# Altium project Servo-Board-v1.0.PrjPcb (part 23 of 23)
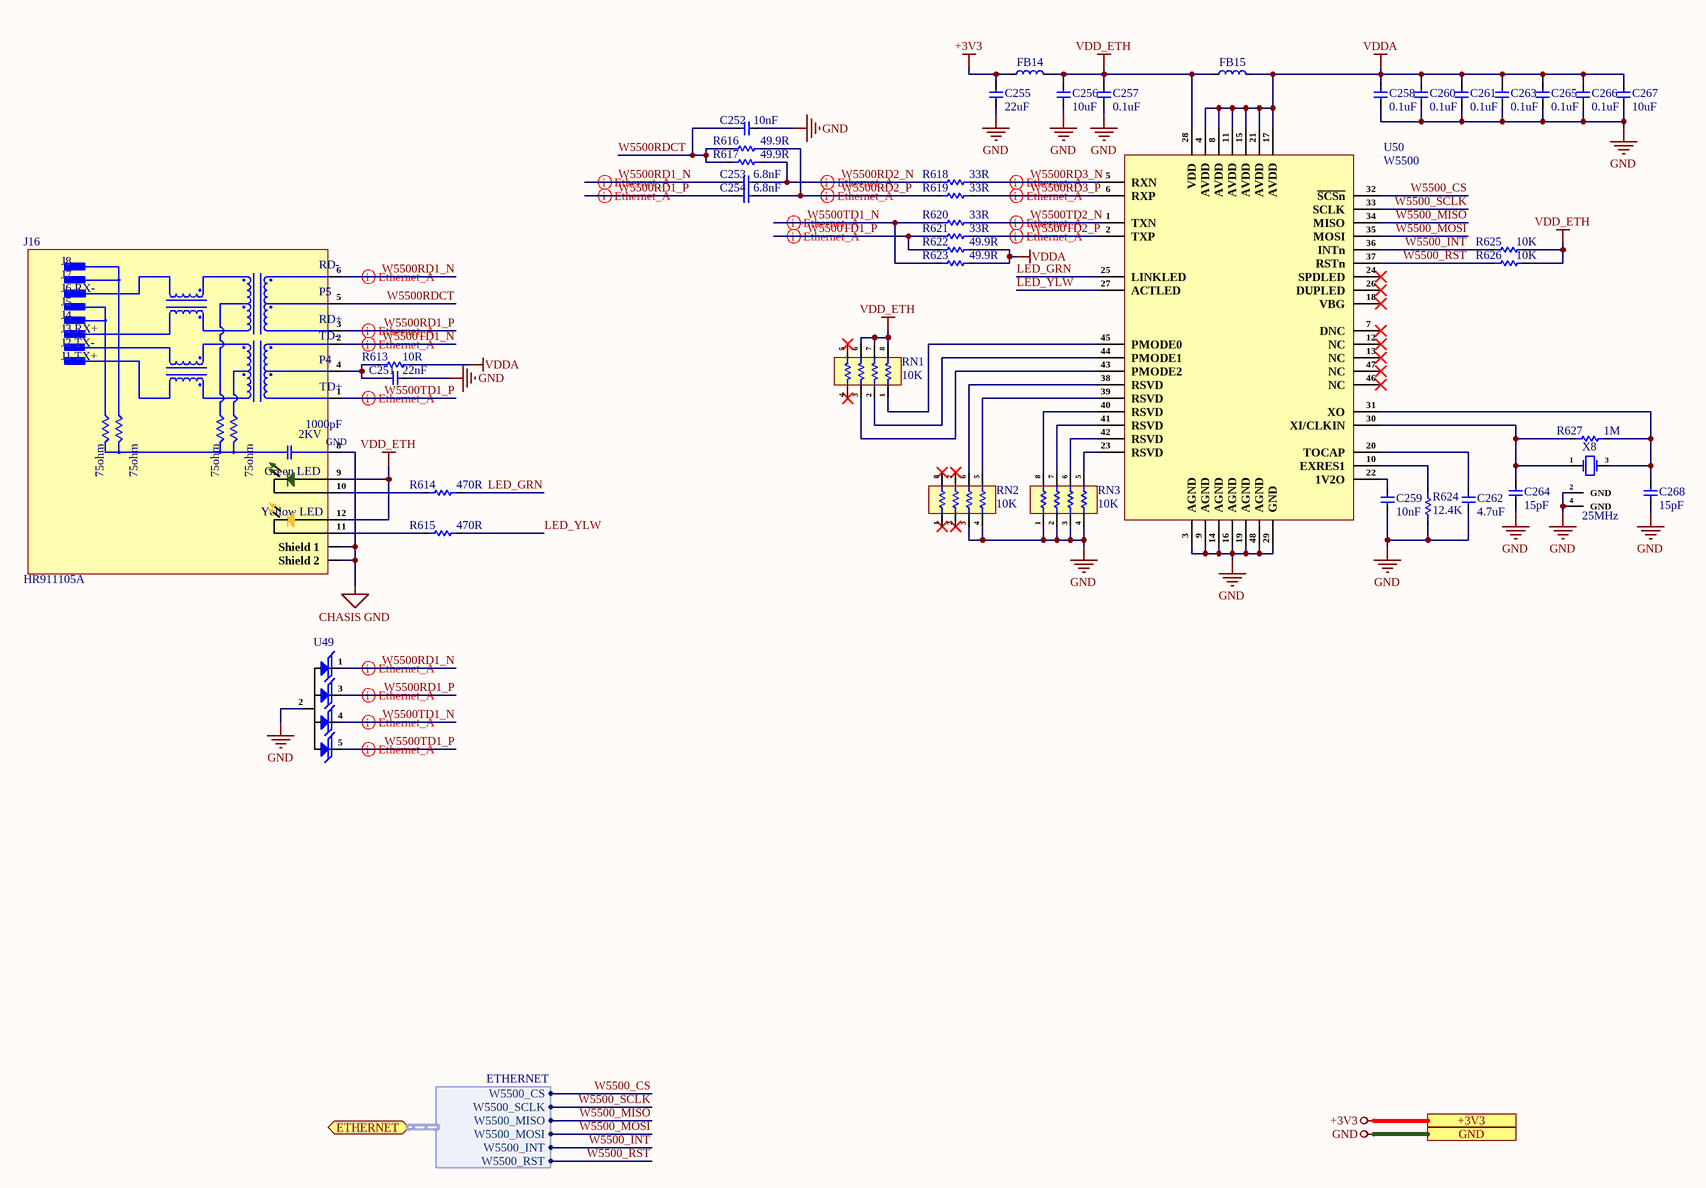
[diagram p27: Ethernet-Sheet.SchDoc]

## Nets that join several sheets
+3V3: Controller_Sheet (14 pins), CAN_Sheet (C54.2 C56.2 U6.5 U7.5), RS485_RS232_Sheet (16 pins), EtherCAT_Sheet (27 pins), Sec_Controller_Sheet3 (16 pins), Motor_Driver_Sheet3 (5 pins), Encoder_Sheet3 (5 pins), DIO_3 (7 pins), Sec_Controller_Sheet4 (16 pins), Motor_Driver_Sheet4 (5 pins), Encoder_Sheet4 (5 pins), DIO_4 (7 pins), Power_Sheet (C52.2 R23.1 TP3.1 U5.3), Sec_Controller_Sheet1 (16 pins), Motor_Driver_Sheet1 (5 pins), Encoder_Sheet1 (5 pins), DIO_1 (7 pins), Sec_Controller_Sheet2 (16 pins), Motor_Driver_Sheet2 (5 pins), Encoder_Sheet2 (5 pins), DIO_2 (7 pins), Ethernet-Sheet (C255.2 FB14.1)
+5V: Controller_Sheet (R12.2), CAN_Sheet (10 pins), Sec_Controller_Sheet3 (R127.2), Encoder_Sheet3 (9 pins), DIO_3 (8 pins), Sec_Controller_Sheet4 (R141.2), Encoder_Sheet4 (9 pins), DIO_4 (8 pins), Power_Sheet (14 pins), Sec_Controller_Sheet1 (R99.2), Encoder_Sheet1 (9 pins), DIO_1 (8 pins), Sec_Controller_Sheet2 (R113.2), Encoder_Sheet2 (9 pins), DIO_2 (8 pins)
+10V: DIO_3 (PT9.1 PT10.1 PT11.1 PT12.1), DIO_4 (PT13.1 PT14.1 PT15.1 PT16.1), Power_Sheet (C20.1 R19.2 U2.15), DIO_1 (PT1.1 PT2.1 PT3.1 PT4.1), DIO_2 (PT5.1 PT6.1 PT7.1 PT8.1)
+24V: DIO_3 (9 pins), DIO_4 (9 pins), Power_Sheet (13 pins), DIO_1 (9 pins), DIO_2 (9 pins)
+24V-MOT-1: Power_Sheet (7 pins), Motor_Driver_Sheet1 (18 pins)
+24V-MOT-2: Power_Sheet (7 pins), Motor_Driver_Sheet2 (18 pins)
+24V-MOT-3: Motor_Driver_Sheet3 (18 pins), Power_Sheet (7 pins)
+24V-MOT-4: Motor_Driver_Sheet4 (18 pins), Power_Sheet (7 pins)
-10V: DIO_3 (R510.2 R512.2 R534.2 R536.2), DIO_4 (R574.2 R576.2 R598.2 R600.2), Power_Sheet (C18.2 R18.2 U2.5), DIO_1 (R387.2 R389.2 R406.2 R408.2), DIO_2 (R450.2 R452.2 R470.2 R472.2)
CHASIS GND: EtherCAT_Sheet (6 pins), Motor_Driver_Sheet3 (J42.4), Encoder_Sheet3 (J49.1), DIO_3 (J54.45 J54.46 J55.45 J55.46), Motor_Driver_Sheet4 (J43.4), Encoder_Sheet4 (J51.1), DIO_4 (J56.45 J56.46 J57.45 J57.46), Power_Sheet (J11.1), Motor_Driver_Sheet1 (J40.4), Encoder_Sheet1 (J26.1), DIO_1 (J25.45 J25.46 J36.45 J36.46), Motor_Driver_Sheet2 (J41.4), Encoder_Sheet2 (J47.1), DIO_2 (J52.45 J52.46 J53.45 J53.46), Ethernet-Sheet (J16.8 J16.Shield 1 J16.Shield 2)
GND: Controller_Sheet (32 pins), CAN_Sheet (20 pins), RS485_RS232_Sheet (19 pins), EtherCAT_Sheet (46 pins), Sec_Controller_Sheet3 (30 pins), Motor_Driver_Sheet3 (41 pins), Encoder_Sheet3 (9 pins), DIO_3 (47 pins), Sec_Controller_Sheet4 (30 pins), Motor_Driver_Sheet4 (41 pins), Encoder_Sheet4 (9 pins), DIO_4 (47 pins), Power_Sheet (57 pins), Sec_Controller_Sheet1 (30 pins), Motor_Driver_Sheet1 (41 pins), Encoder_Sheet1 (9 pins), DIO_1 (47 pins), Sec_Controller_Sheet2 (30 pins), Motor_Driver_Sheet2 (41 pins), Encoder_Sheet2 (9 pins), DIO_2 (47 pins), Ethernet-Sheet (33 pins)
CAL-1: Sec_Controller_Sheet1 (U13.65), Motor_Driver_Sheet1 (U17.34)
CAL-2: Sec_Controller_Sheet2 (U14.65), Motor_Driver_Sheet2 (U18.34)
CAL-3: Sec_Controller_Sheet3 (U15.65), Motor_Driver_Sheet3 (U19.34)
CAL-4: Sec_Controller_Sheet4 (U16.65), Motor_Driver_Sheet4 (U20.34)
CAN1_RX: Controller_Sheet (U1.50), CAN_Sheet (R30.2)
CAN1_TX: Controller_Sheet (U1.51), CAN_Sheet (R31.2)
CAN2_RX: Controller_Sheet (U1.15), CAN_Sheet (R32.2)
CAN2_TX: Controller_Sheet (U1.16), CAN_Sheet (R33.2)
DRV_EN-1: Sec_Controller_Sheet1 (U13.97), Motor_Driver_Sheet1 (U17.33)
DRV_EN-2: Sec_Controller_Sheet2 (U14.97), Motor_Driver_Sheet2 (U18.33)
DRV_EN-3: Sec_Controller_Sheet3 (U15.97), Motor_Driver_Sheet3 (U19.33)
DRV_EN-4: Sec_Controller_Sheet4 (U16.97), Motor_Driver_Sheet4 (U20.33)
EN_CAN: Controller_Sheet (U1.57), CAN_Sheet (U6.6)
EN_CAN_2: Controller_Sheet (U1.39), CAN_Sheet (U7.6)
EXTI1-1: Sec_Controller_Sheet1 (U13.98), DIO_1 (R355.1)
EXTI1-2: Sec_Controller_Sheet2 (U14.98), DIO_2 (R418.1)
EXTI1-3: Sec_Controller_Sheet3 (U15.98), DIO_3 (R482.1)
EXTI1-4: Sec_Controller_Sheet4 (U16.98), DIO_4 (R546.1)
EXTI2-1: Sec_Controller_Sheet1 (U13.1), DIO_1 (R356.1)
EXTI2-2: Sec_Controller_Sheet2 (U14.1), DIO_2 (R419.1)
EXTI2-3: Sec_Controller_Sheet3 (U15.1), DIO_3 (R483.1)
EXTI2-4: Sec_Controller_Sheet4 (U16.1), DIO_4 (R547.1)
EXTI3-1: Sec_Controller_Sheet1 (U13.2), DIO_1 (R357.1)
EXTI3-2: Sec_Controller_Sheet2 (U14.2), DIO_2 (R420.1)
EXTI3-3: Sec_Controller_Sheet3 (U15.2), DIO_3 (R484.1)
EXTI3-4: Sec_Controller_Sheet4 (U16.2), DIO_4 (R548.1)
EXTI4-1: Sec_Controller_Sheet1 (U13.3), DIO_1 (R358.1)
EXTI4-2: Sec_Controller_Sheet2 (U14.3), DIO_2 (R421.1)
EXTI4-3: Sec_Controller_Sheet3 (U15.3), DIO_3 (R485.1)
EXTI4-4: Sec_Controller_Sheet4 (U16.3), DIO_4 (R549.1)
EXTI5-1: Sec_Controller_Sheet1 (U13.4), DIO_1 (R359.1)
EXTI5-2: Sec_Controller_Sheet2 (U14.4), DIO_2 (R422.1)
EXTI5-3: Sec_Controller_Sheet3 (U15.4), DIO_3 (R486.1)
EXTI5-4: Sec_Controller_Sheet4 (U16.4), DIO_4 (R550.1)
EXTI6-1: Sec_Controller_Sheet1 (U13.5), DIO_1 (R360.1)
EXTI6-2: Sec_Controller_Sheet2 (U14.5), DIO_2 (R423.1)
EXTI6-3: Sec_Controller_Sheet3 (U15.5), DIO_3 (R487.1)
EXTI6-4: Sec_Controller_Sheet4 (U16.5), DIO_4 (R551.1)
EXTI7-1: Sec_Controller_Sheet1 (U13.38), DIO_1 (R361.1)
EXTI7-2: Sec_Controller_Sheet2 (U14.38), DIO_2 (R424.1)
EXTI7-3: Sec_Controller_Sheet3 (U15.38), DIO_3 (R488.1)
EXTI7-4: Sec_Controller_Sheet4 (U16.38), DIO_4 (R552.1)
EXTI8-1: Sec_Controller_Sheet1 (U13.39), DIO_1 (R362.1)
EXTI8-2: Sec_Controller_Sheet2 (U14.39), DIO_2 (R425.1)
EXTI8-3: Sec_Controller_Sheet3 (U15.39), DIO_3 (R489.1)
EXTI8-4: Sec_Controller_Sheet4 (U16.39), DIO_4 (R553.1)
EXTO1-1: Sec_Controller_Sheet1 (U13.40), DIO_1 (R379.1 U29.16)
EXTO1-2: Sec_Controller_Sheet2 (U14.40), DIO_2 (R442.1 U36.16)
EXTO1-3: Sec_Controller_Sheet3 (U15.40), DIO_3 (R506.1 U41.16)
EXTO1-4: Sec_Controller_Sheet4 (U16.40), DIO_4 (R570.1 U46.16)
EXTO2-1: Sec_Controller_Sheet1 (U13.41), DIO_1 (R377.1 U29.14)
EXTO2-2: Sec_Controller_Sheet2 (U14.41), DIO_2 (R440.1 U36.14)
EXTO2-3: Sec_Controller_Sheet3 (U15.41), DIO_3 (R504.1 U41.14)
EXTO2-4: Sec_Controller_Sheet4 (U16.41), DIO_4 (R568.1 U46.14)
EXTO3-1: Sec_Controller_Sheet1 (U13.42), DIO_1 (R376.1 U29.12)
EXTO3-2: Sec_Controller_Sheet2 (U14.42), DIO_2 (R439.1 U36.12)
EXTO3-3: Sec_Controller_Sheet3 (U15.42), DIO_3 (R503.1 U41.12)
EXTO3-4: Sec_Controller_Sheet4 (U16.42), DIO_4 (R567.1 U46.12)
EXTO4-1: Sec_Controller_Sheet1 (U13.43), DIO_1 (R375.1 U29.10)
EXTO4-2: Sec_Controller_Sheet2 (U14.43), DIO_2 (R438.1 U36.10)
EXTO4-3: Sec_Controller_Sheet3 (U15.43), DIO_3 (R502.1 U41.10)
EXTO4-4: Sec_Controller_Sheet4 (U16.43), DIO_4 (R566.1 U46.10)
EXTO5-1: Sec_Controller_Sheet1 (U13.44), DIO_1 (R380.1 U30.16)
EXTO5-2: Sec_Controller_Sheet2 (U14.44), DIO_2 (R443.1 U37.16)
EXTO5-3: Sec_Controller_Sheet3 (U15.44), DIO_3 (R507.1 U42.16)
EXTO5-4: Sec_Controller_Sheet4 (U16.44), DIO_4 (R571.1 U47.16)
EXTO6-1: Sec_Controller_Sheet1 (U13.45), DIO_1 (R378.1 U30.14)
EXTO6-2: Sec_Controller_Sheet2 (U14.45), DIO_2 (R441.1 U37.14)
EXTO6-3: Sec_Controller_Sheet3 (U15.45), DIO_3 (R505.1 U42.14)
EXTO6-4: Sec_Controller_Sheet4 (U16.45), DIO_4 (R569.1 U47.14)
EXTOCZ-1: Sec_Controller_Sheet1 (U13.81), DIO_1 (U31.5)
EXTOCZ-2: Sec_Controller_Sheet2 (U14.81), DIO_2 (U38.5)
EXTOCZ-3: Sec_Controller_Sheet3 (U15.81), DIO_3 (U43.5)
EXTOCZ-4: Sec_Controller_Sheet4 (U16.81), DIO_4 (U48.5)
FAULT-1: Sec_Controller_Sheet1 (U13.66), Motor_Driver_Sheet1 (R145.2 R148.2 U17.28)
FAULT-2: Sec_Controller_Sheet2 (U14.66), Motor_Driver_Sheet2 (R178.2 R181.2 U18.28)
FAULT-3: Sec_Controller_Sheet3 (U15.66), Motor_Driver_Sheet3 (R211.2 R214.2 U19.28)
FAULT-4: Sec_Controller_Sheet4 (U16.66), Motor_Driver_Sheet4 (R244.2 R247.2 U20.28)
INH_MASK: Controller_Sheet (U1.58), CAN_Sheet (U6.11)
INH_MASK_2: Controller_Sheet (U1.36), CAN_Sheet (U7.11)
INHA-1: Sec_Controller_Sheet1 (U13.67), Motor_Driver_Sheet1 (D24.3 U17.37)
INHA-2: Sec_Controller_Sheet2 (U14.67), Motor_Driver_Sheet2 (D29.1 U18.37)
INHA-3: Sec_Controller_Sheet3 (U15.67), Motor_Driver_Sheet3 (D34.3 U19.37)
INHA-4: Sec_Controller_Sheet4 (U16.67), Motor_Driver_Sheet4 (D39.1 U20.37)
INHB-1: Sec_Controller_Sheet1 (U13.68), Motor_Driver_Sheet1 (D24.4 U17.39)
INHB-2: Sec_Controller_Sheet2 (U14.68), Motor_Driver_Sheet2 (D29.6 U18.39)
INHB-3: Sec_Controller_Sheet3 (U15.68), Motor_Driver_Sheet3 (D34.4 U19.39)
INHB-4: Sec_Controller_Sheet4 (U16.68), Motor_Driver_Sheet4 (D39.6 U20.39)
INHC-1: Sec_Controller_Sheet1 (U13.69), Motor_Driver_Sheet1 (D26.6 U17.41)
INHC-2: Sec_Controller_Sheet2 (U14.69), Motor_Driver_Sheet2 (D31.6 U18.41)
INHC-3: Sec_Controller_Sheet3 (U15.69), Motor_Driver_Sheet3 (D36.6 U19.41)
INHC-4: Sec_Controller_Sheet4 (U16.69), Motor_Driver_Sheet4 (D41.6 U20.41)
INLA-1: Sec_Controller_Sheet1 (U13.34), Motor_Driver_Sheet1 (D24.1 U17.38)
INLA-2: Sec_Controller_Sheet2 (U14.34), Motor_Driver_Sheet2 (D29.3 U18.38)
INLA-3: Sec_Controller_Sheet3 (U15.34), Motor_Driver_Sheet3 (D34.1 U19.38)
INLA-4: Sec_Controller_Sheet4 (U16.34), Motor_Driver_Sheet4 (D39.3 U20.38)
INLB-1: Sec_Controller_Sheet1 (U13.63), Motor_Driver_Sheet1 (D24.6 U17.40)
INLB-2: Sec_Controller_Sheet2 (U14.63), Motor_Driver_Sheet2 (D29.4 U18.40)
INLB-3: Sec_Controller_Sheet3 (U15.63), Motor_Driver_Sheet3 (D34.6 U19.40)
INLB-4: Sec_Controller_Sheet4 (U16.63), Motor_Driver_Sheet4 (D39.4 U20.40)
INLC-1: Sec_Controller_Sheet1 (U13.64), Motor_Driver_Sheet1 (D26.4 U17.42)
INLC-2: Sec_Controller_Sheet2 (U14.64), Motor_Driver_Sheet2 (D31.4 U18.42)
INLC-3: Sec_Controller_Sheet3 (U15.64), Motor_Driver_Sheet3 (D36.4 U19.42)
INLC-4: Sec_Controller_Sheet4 (U16.64), Motor_Driver_Sheet4 (D41.4 U20.42)
ISENA-1: Sec_Controller_Sheet1 (U13.15), Motor_Driver_Sheet1 (C126.2 D25.4 R163.2)
ISENA-2: Sec_Controller_Sheet2 (U14.15), Motor_Driver_Sheet2 (C151.2 D30.4 R196.2)
ISENA-3: Sec_Controller_Sheet3 (U15.15), Motor_Driver_Sheet3 (C176.2 D35.4 R229.2)
ISENA-4: Sec_Controller_Sheet4 (U16.15), Motor_Driver_Sheet4 (C201.2 D40.4 R263.2)
ISENB-1: Sec_Controller_Sheet1 (U13.16), Motor_Driver_Sheet1 (C127.2 D25.6 R164.2)
ISENB-2: Sec_Controller_Sheet2 (U14.16), Motor_Driver_Sheet2 (C152.2 D30.6 R197.2)
ISENB-3: Sec_Controller_Sheet3 (U15.16), Motor_Driver_Sheet3 (C177.2 D35.6 R230.2)
ISENB-4: Sec_Controller_Sheet4 (U16.16), Motor_Driver_Sheet4 (C202.2 D40.6 R264.2)
ISENC-1: Sec_Controller_Sheet1 (U13.17), Motor_Driver_Sheet1 (C128.2 D25.1 R165.2)
ISENC-2: Sec_Controller_Sheet2 (U14.17), Motor_Driver_Sheet2 (C153.2 D30.1 R198.2)
ISENC-3: Sec_Controller_Sheet3 (U15.17), Motor_Driver_Sheet3 (C178.2 D35.1 R231.2)
ISENC-4: Sec_Controller_Sheet4 (U16.17), Motor_Driver_Sheet4 (C203.2 D40.1 R265.2)
LPUART1_RX: Controller_Sheet (U1.13), Sec_Controller_Sheet4 (R136.1)
LPUART1_TX: Controller_Sheet (U1.14), Sec_Controller_Sheet4 (R137.1)
MON1-1: Sec_Controller_Sheet1 (U13.18), DIO_1 (D46.2 R414.1 R415.2)
MON1-2: Sec_Controller_Sheet2 (U14.18), DIO_2 (D48.2 R478.1 R479.2)
MON1-3: Sec_Controller_Sheet3 (U15.18), DIO_3 (D50.2 R542.1 R543.2)
MON1-4: Sec_Controller_Sheet4 (U16.18), DIO_4 (D52.2 R606.1 R607.2)
MON2-1: Sec_Controller_Sheet1 (U13.33), DIO_1 (D47.2 R416.1 R417.2)
MON2-2: Sec_Controller_Sheet2 (U14.33), DIO_2 (D49.2 R480.1 R481.2)
MON2-3: Sec_Controller_Sheet3 (U15.33), DIO_3 (D51.2 R544.1 R545.2)
MON2-4: Sec_Controller_Sheet4 (U16.33), DIO_4 (D53.2 R608.1 R609.2)
nFAULT_CAN: Controller_Sheet (U1.56), CAN_Sheet (U6.8)
nFAULT_CAN_2: Controller_Sheet (U1.42), CAN_Sheet (U7.8)
nSTB_CAN: Controller_Sheet (U1.55), CAN_Sheet (U6.14)
nSTB_CAN_2: Controller_Sheet (U1.34), CAN_Sheet (U7.14)
PULSEE-1: Sec_Controller_Sheet1 (U13.82), DIO_1 (R363.1)
PULSEE-2: Sec_Controller_Sheet2 (U14.82), DIO_2 (R426.1)
PULSEE-3: Sec_Controller_Sheet3 (U15.82), DIO_3 (R490.1)
PULSEE-4: Sec_Controller_Sheet4 (U16.82), DIO_4 (R554.1)
RE/DE/RS485/T: Controller_Sheet (U1.41), RS485_RS232_Sheet (R48.1 R50.1 U8.2 U8.3)
RE/DE/RS485/T-2: Controller_Sheet (U1.40), RS485_RS232_Sheet (R49.1 R51.1 U9.2 U9.3)
RE/DE_ENC-1: Sec_Controller_Sheet1 (U13.95), Encoder_Sheet1 (Q2.2 R82.2)
RE/DE_ENC-2: Sec_Controller_Sheet2 (U14.95), Encoder_Sheet2 (Q15.2 R315.2)
RE/DE_ENC-3: Sec_Controller_Sheet3 (U15.95), Encoder_Sheet3 (Q16.2 R333.2)
RE/DE_ENC-4: Sec_Controller_Sheet4 (U16.95), Encoder_Sheet4 (Q17.2 R351.2)
RX_MCU_ENC-1: Sec_Controller_Sheet1 (U13.93), Encoder_Sheet1 (R74.2)
RX_MCU_ENC-2: Sec_Controller_Sheet2 (U14.93), Encoder_Sheet2 (R307.2)
RX_MCU_ENC-3: Sec_Controller_Sheet3 (U15.93), Encoder_Sheet3 (R325.2)
RX_MCU_ENC-4: Sec_Controller_Sheet4 (U16.93), Encoder_Sheet4 (R343.2)
RXD/RS232: Controller_Sheet (U1.31), RS485_RS232_Sheet (R67.2)
RXD/RS485: Controller_Sheet (U1.19), RS485_RS232_Sheet (R43.1)
RXD/RS485-2: Controller_Sheet (U1.62), RS485_RS232_Sheet (R45.1)
SIGNN-1: Sec_Controller_Sheet1 (U13.83), DIO_1 (R364.1)
SIGNN-2: Sec_Controller_Sheet2 (U14.83), DIO_2 (R427.1)
SIGNN-3: Sec_Controller_Sheet3 (U15.83), DIO_3 (R491.1)
SIGNN-4: Sec_Controller_Sheet4 (U16.83), DIO_4 (R555.1)
SPI3_CS: Controller_Sheet (U1.47), EtherCAT_Sheet (U21.50)
SPI3_MISO: Controller_Sheet (U1.1), EtherCAT_Sheet (U21.13)
SPI3_MOSI: Controller_Sheet (U1.2), EtherCAT_Sheet (U21.17)
SPI3_SCK: Controller_Sheet (U1.64), EtherCAT_Sheet (U21.19)
SPI_CS-1: Sec_Controller_Sheet1 (U13.29), Motor_Driver_Sheet1 (U17.32)
SPI_CS-2: Sec_Controller_Sheet2 (U14.29), Motor_Driver_Sheet2 (U18.32)
SPI_CS-3: Sec_Controller_Sheet3 (U15.29), Motor_Driver_Sheet3 (U19.32)
SPI_CS-4: Sec_Controller_Sheet4 (U16.29), Motor_Driver_Sheet4 (U20.32)
SPI_MISO-1: Sec_Controller_Sheet1 (U13.31), Motor_Driver_Sheet1 (R144.2 U17.29)
SPI_MISO-2: Sec_Controller_Sheet2 (U14.31), Motor_Driver_Sheet2 (R177.2 U18.29)
SPI_MISO-3: Sec_Controller_Sheet3 (U15.31), Motor_Driver_Sheet3 (R210.2 U19.29)
SPI_MISO-4: Sec_Controller_Sheet4 (U16.31), Motor_Driver_Sheet4 (R243.2 U20.29)
SPI_MOSI-1: Sec_Controller_Sheet1 (U13.32), Motor_Driver_Sheet1 (U17.30)
SPI_MOSI-2: Sec_Controller_Sheet2 (U14.32), Motor_Driver_Sheet2 (U18.30)
SPI_MOSI-3: Sec_Controller_Sheet3 (U15.32), Motor_Driver_Sheet3 (U19.30)
SPI_MOSI-4: Sec_Controller_Sheet4 (U16.32), Motor_Driver_Sheet4 (U20.30)
SPI_SCLK-1: Sec_Controller_Sheet1 (U13.30), Motor_Driver_Sheet1 (U17.31)
SPI_SCLK-2: Sec_Controller_Sheet2 (U14.30), Motor_Driver_Sheet2 (U18.31)
SPI_SCLK-3: Sec_Controller_Sheet3 (U15.30), Motor_Driver_Sheet3 (U19.31)
SPI_SCLK-4: Sec_Controller_Sheet4 (U16.30), Motor_Driver_Sheet4 (U20.31)
SYNC0: Controller_Sheet (U1.37), EtherCAT_Sheet (U21.34)
SYNC1: Controller_Sheet (U1.38), EtherCAT_Sheet (U21.18)
TX_MCU_ENC-1: Sec_Controller_Sheet1 (U13.92), Encoder_Sheet1 (R75.2)
TX_MCU_ENC-2: Sec_Controller_Sheet2 (U14.92), Encoder_Sheet2 (R308.2)
TX_MCU_ENC-3: Sec_Controller_Sheet3 (U15.92), Encoder_Sheet3 (R326.2)
TX_MCU_ENC-4: Sec_Controller_Sheet4 (U16.92), Encoder_Sheet4 (R344.2)
TXD/RS232: Controller_Sheet (U1.30), RS485_RS232_Sheet (R66.2)
TXD/RS485: Controller_Sheet (U1.20), RS485_RS232_Sheet (R42.1)
TXD/RS485-2: Controller_Sheet (U1.63), RS485_RS232_Sheet (R44.1)
USART1_RX: Controller_Sheet (U1.26), Sec_Controller_Sheet1 (R94.1)
USART1_TX: Controller_Sheet (U1.25), Sec_Controller_Sheet1 (R95.1)
USART4_RX: Controller_Sheet (U1.18), Sec_Controller_Sheet3 (R122.1)
USART4_TX: Controller_Sheet (U1.17), Sec_Controller_Sheet3 (R123.1)
USART5_RX: Controller_Sheet (U1.28), Sec_Controller_Sheet2 (R108.1)
USART5_TX: Controller_Sheet (U1.27), Sec_Controller_Sheet2 (R109.1)
VSENA-1: Sec_Controller_Sheet1 (U13.24), Motor_Driver_Sheet1 (5 pins)
VSENA-2: Sec_Controller_Sheet2 (U14.24), Motor_Driver_Sheet2 (5 pins)
VSENA-3: Sec_Controller_Sheet3 (U15.24), Motor_Driver_Sheet3 (5 pins)
VSENA-4: Sec_Controller_Sheet4 (U16.24), Motor_Driver_Sheet4 (5 pins)
VSENB-1: Sec_Controller_Sheet1 (U13.35), Motor_Driver_Sheet1 (5 pins)
VSENB-2: Sec_Controller_Sheet2 (U14.35), Motor_Driver_Sheet2 (5 pins)
VSENB-3: Sec_Controller_Sheet3 (U15.35), Motor_Driver_Sheet3 (5 pins)
VSENB-4: Sec_Controller_Sheet4 (U16.35), Motor_Driver_Sheet4 (5 pins)
VSENC-1: Sec_Controller_Sheet1 (U13.36), Motor_Driver_Sheet1 (5 pins)
VSENC-2: Sec_Controller_Sheet2 (U14.36), Motor_Driver_Sheet2 (5 pins)
VSENC-3: Sec_Controller_Sheet3 (U15.36), Motor_Driver_Sheet3 (5 pins)
VSENC-4: Sec_Controller_Sheet4 (U16.36), Motor_Driver_Sheet4 (5 pins)
W5500_CS: Controller_Sheet (U1.32), Ethernet-Sheet (U50.32)
W5500_INT: Controller_Sheet (U1.49), Ethernet-Sheet (R625.1 U50.36)
W5500_MISO: Controller_Sheet (U1.29), Ethernet-Sheet (U50.34)
W5500_MOSI: Controller_Sheet (U1.35), Ethernet-Sheet (U50.35)
W5500_RST: Controller_Sheet (U1.48), Ethernet-Sheet (R626.1 U50.37)
W5500_SCLK: Controller_Sheet (U1.33), Ethernet-Sheet (U50.33)